# Altium schematic sheet 基础拓扑推导-2.SchDoc
size 1651 x 1651 mm; SheetNumber: 2; SheetTotal: 15
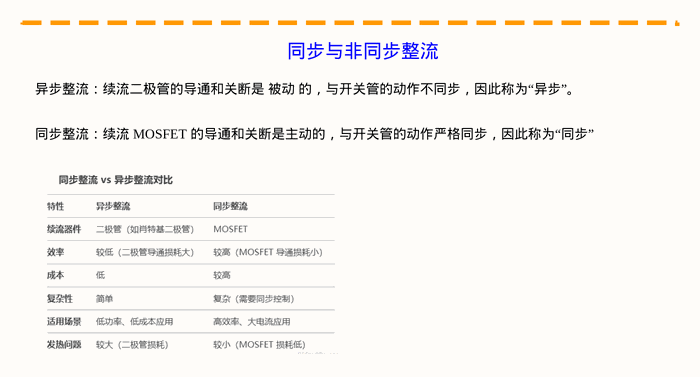
[diagram p0: 基础拓扑推导-2.SchDoc]

## Notes on the sheet
- 同步与非同步整流
- 异步整流：续流二极管的导通和关断是 被动 的，与开关管的动作不同步，因此称为“异步”。
- 同步整流：续流 MOSFET 的导通和关断是主动的，与开关管的动作严格同步，因此称为“同步”